# Altium project BOB.PrjPcb (part 2 of 2)
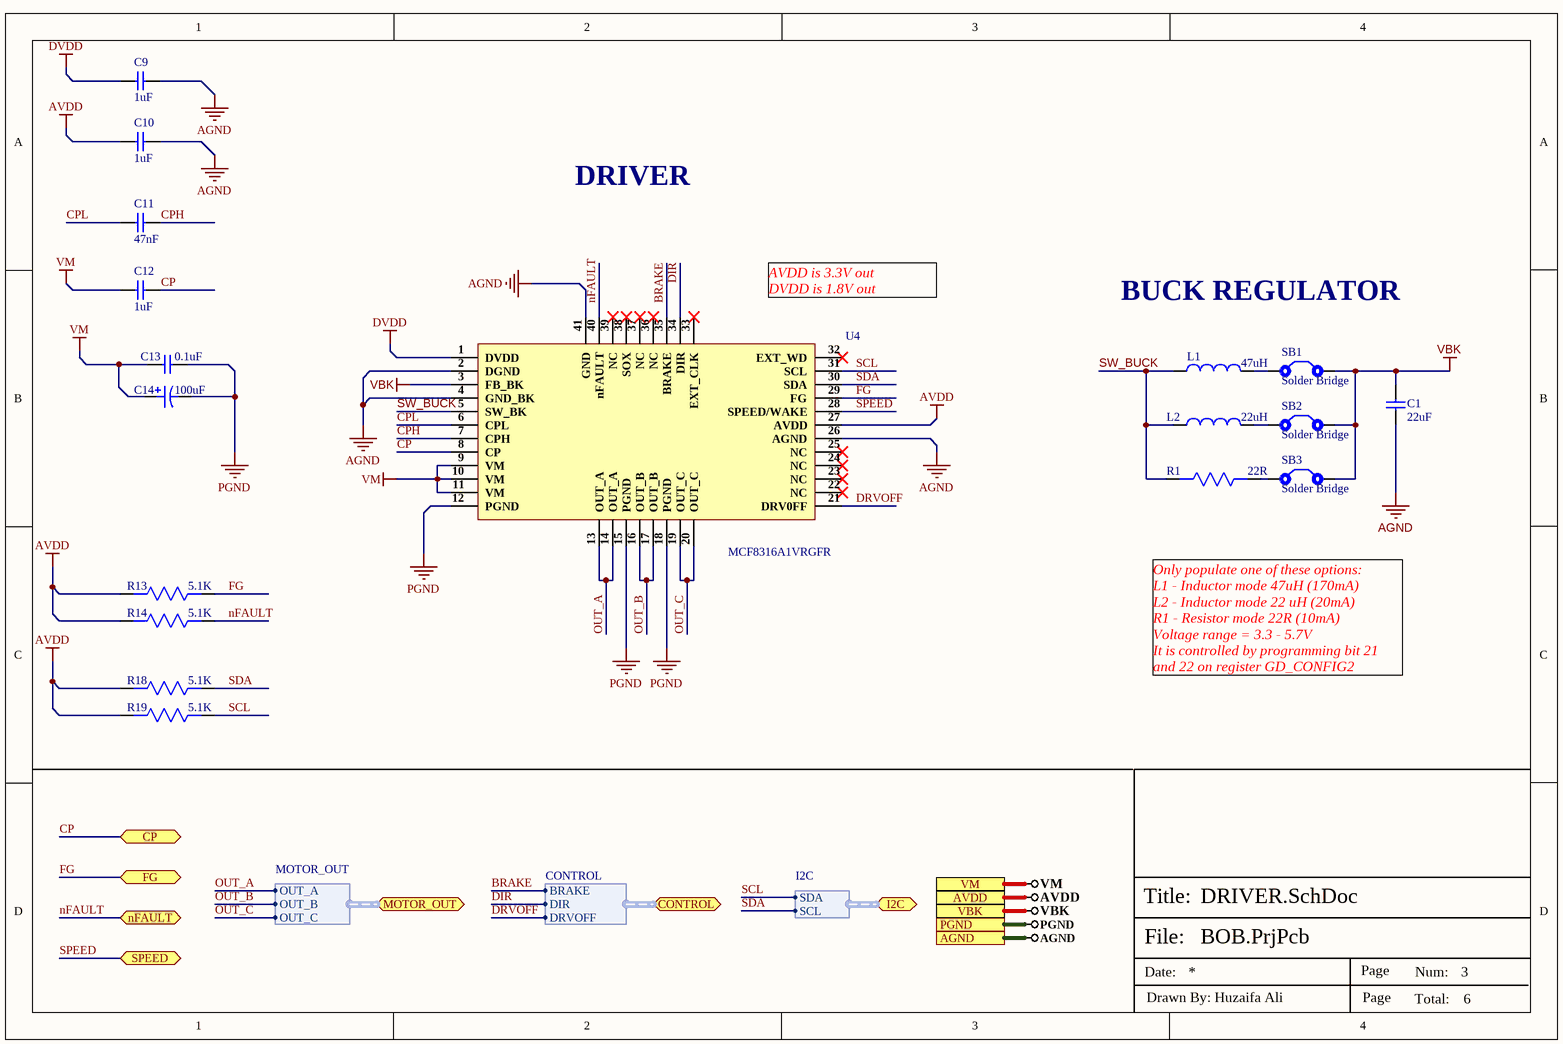
[diagram p6: DRIVER.SchDoc]

## Nets that join several sheets
3V3_ENC: Encoder (C17.1 SB4.2 U1.1 U1.2), Header_Connector (P3.6)
AGND: Control_Indicator (R8.2 R9.2 R10.2), Encoder (SB5.1), DRIVER (7 pins)
AVDD: Control_Indicator (R3.1 R4.1 R5.1), Encoder (R7.2 R12.2 R15.2 SB4.1), DRIVER (6 pins)
GND_ENC: Encoder (C17.2 SB5.2 U1.4), Header_Connector (P3.5)
PGND: Control_Indicator (R16.2), Power Supply (10 pins), Header_Connector (P1.2), DRIVER (5 pins)
VBK: Control_Indicator (LED1.1), Header_Connector (P2.5), DRIVER (5 pins)
VM: Control_Indicator (LED2.1), Power Supply (6 pins), Header_Connector (P1.3), DRIVER (6 pins)
VM_IN: Power Supply (D1.1 Q2.1 Q2.2 Q2.3), Header_Connector (P1.1)
BRAKE: Control_Indicator (SW1.2), DRIVER (U4.35)
CP: Power Supply (R2.1), DRIVER (C12.2 U4.8)
CSN_ENC: Encoder (R7.1 U1.8), Header_Connector (P3.4)
DIR: Control_Indicator (SW3.2), DRIVER (U4.34)
DRVOFF: Control_Indicator (SW2.2), DRIVER (U4.21)
FG: Header_Connector (P2.4), DRIVER (R13.1 U4.29)
nFAULT: Control_Indicator (R6.2), DRIVER (R14.1 U4.40)
OUT_A: Header_Connector (P4.1), DRIVER (U4.13 U4.14)
OUT_B: Header_Connector (P4.2), DRIVER (U4.16 U4.17)
OUT_C: Header_Connector (P4.3), DRIVER (U4.19 U4.20)
SCL: Header_Connector (P2.2), DRIVER (R19.1 U4.31)
SCL_ENC: Encoder (R12.1 U1.7), Header_Connector (P3.3)
SDA: Header_Connector (P2.1), DRIVER (R18.1 U4.30)
SDA_ENC: Encoder (R15.1 U1.6), Header_Connector (P3.2)
SPEED: Header_Connector (P2.3), DRIVER (U4.28)